# Altium schematic sheet System_CLK.SchDoc: Dystrybutory zegarów
size A3; Organization: Altium Limited; Address1: L3, 12a Rodborough Rd; Address2: Frenchs Forest; Address3: NSW; Address4: Australia 2086
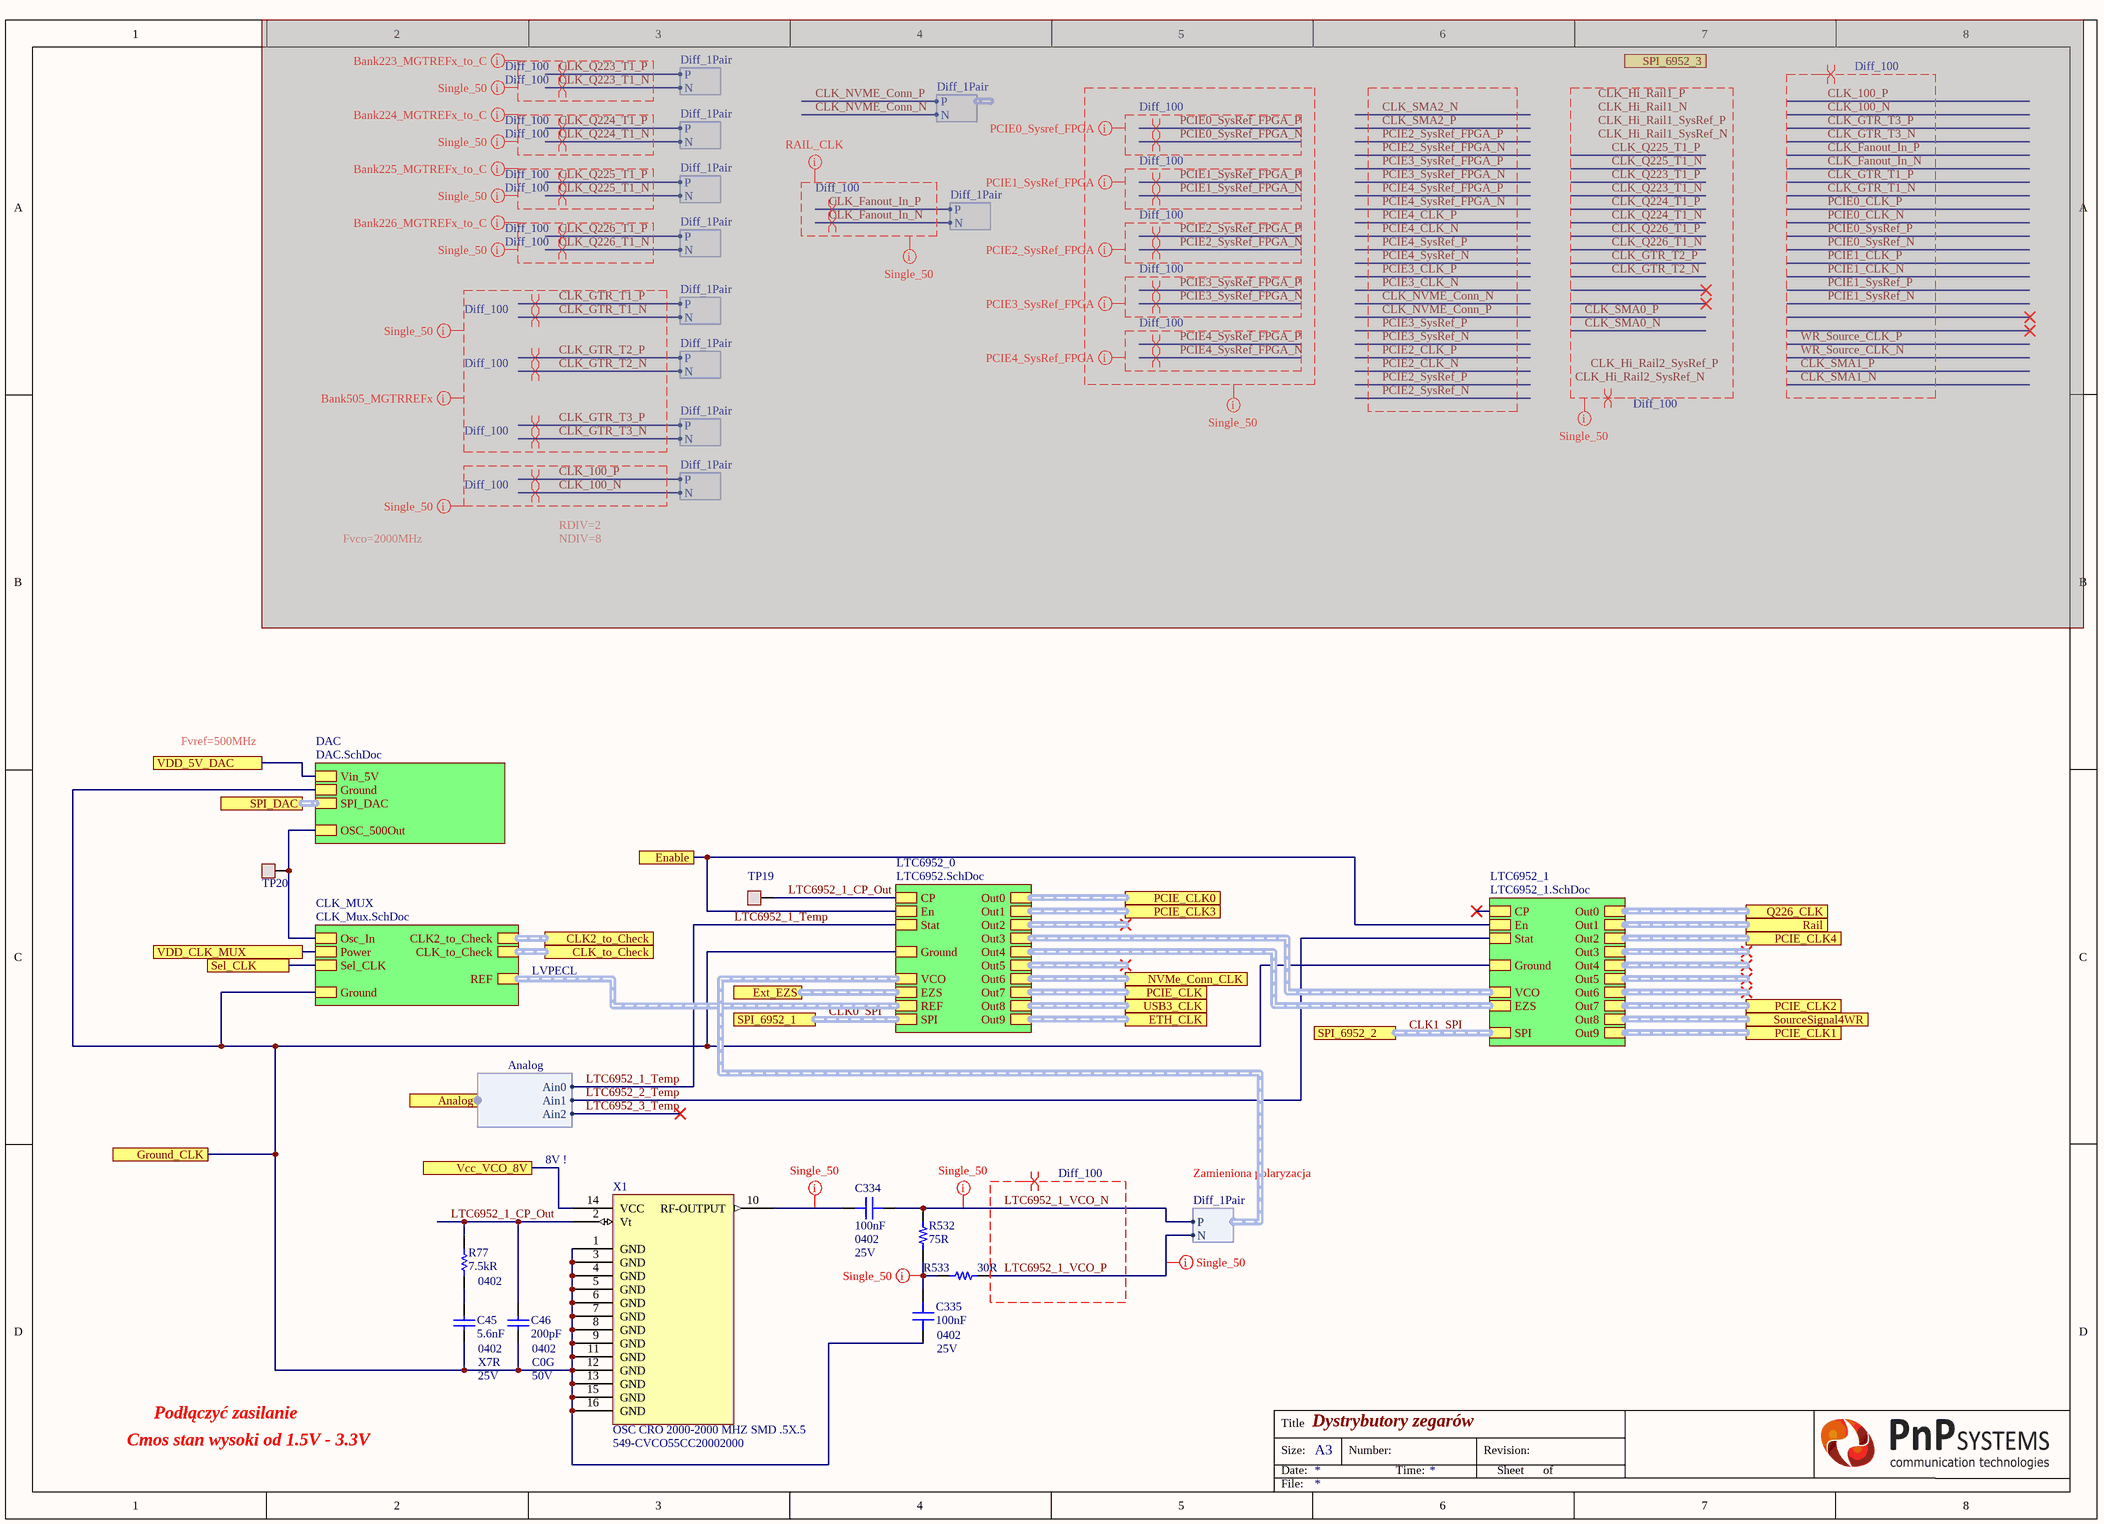
[diagram p0: System_CLK.SchDoc]

## Parts
C45  5.6nF  Case Code (Imperial): 0402  Voltage Rating: 25V  Dielectric: X7R  [CAP 0402/1005 KK]
C46  200pF  Case/Package: 0402  Voltage Rating: 50V  Dielectric: C0G  [CAP 0402/1005 KK]
C334  100nF  Case/Package: 0402  Voltage Rating: 25V  [CAP 0402/1005 KK]
C335  100nF  Case/Package: 0402  Voltage Rating: 25V  [CAP 0402/1005 KK]
R77  7.5kR  Case Code (Imperial): 0402  [RES 0402/1005 RF KK]
R532  75R  [RES 0402/1005 RF KK]
R533  30R  [RES 0402/1005 RF KK]
TP19  TestPoint  [TestPoint]  (value not drawn)
TP20  TestPoint  [TestPoint]  (value not drawn)
X1  OSC CRO 2000-2000 MHZ SMD .5X.5  Supplier Part Number 1: 549-CVCO55CC20002000  [CVCO55CW]

## Sub-sheets
CLK_MUX = CLK_Mux.SchDoc: Sel_CLK, REF (harness Diff_1Pair), Osc_In, Ground, Power, CLK_to_Check (harness Diff_1Pair), CLK2_to_Check (harness Diff_1Pair)
DAC = DAC.SchDoc: Vin_5V, SPI_DAC (harness SPI_H), Ground, OSC_500Out
LTC6952_0 = LTC6952.SchDoc: CP, Ground, Out6 (harness Diff_1Pair), VCO (harness Diff_1Pair), SPI (harness SPI_H), Stat, Out1 (harness Diff_1Pair), En, Out5 (harness Diff_1Pair), Out0 (harness Diff_1Pair), EZS (harness Diff_1Pair), Out2 (harness Diff_1Pair), Out7 (harness Diff_1Pair), REF (harness Diff_1Pair), Out8 (harness Diff_1Pair), Out3 (harness Diff_1Pair), Out4 (harness Diff_1Pair), Out9 (harness Diff_1Pair)
LTC6952_1 = LTC6952_1.SchDoc: EZS (harness Diff_1Pair), SPI (harness SPI_H), En, Out5 (harness Diff_1Pair), Ground, CP, Out4 (harness Diff_1Pair), Out6 (harness Diff_1Pair), VCO (harness Diff_1Pair), Out9 (harness Diff_1Pair), Stat, Out7 (harness Diff_1Pair), Out3 (harness Diff_1Pair), Out0 (harness Diff_1Pair), Out8 (harness Diff_1Pair), Out2 (harness Diff_1Pair), Out1 (harness Diff_1Pair)

## Ports
Analog (harness Analog), CLK2_to_Check (harness Diff_1Pair), CLK_to_Check (harness Diff_1Pair), Enable, ETH_CLK (harness Diff_1Pair), Ext_EZS (harness Diff_1Pair), Ground_CLK, NVMe_Conn_CLK (harness Diff_1Pair), PCIE_CLK0 (harness Diff_1Pair), PCIE_CLK1 (harness Diff_1Pair), PCIE_CLK2 (harness Diff_1Pair), PCIE_CLK3 (harness Diff_1Pair), PCIE_CLK4 (harness Diff_1Pair), PCIE_CLK (harness Diff_1Pair), Q226_CLK (harness Diff_1Pair), Rail (harness Diff_1Pair), Sel_CLK, SourceSignal4WR (harness Diff_1Pair), SPI_6952_1 (harness SPI_H), SPI_6952_2 (harness SPI_H), SPI_6952_3 (harness SPI_H), SPI_DAC (harness SPI_H), USB3_CLK (harness Diff_1Pair), Vcc_VCO_8V, VDD_5V_DAC, VDD_CLK_MUX

## Harnesses
Diff_1Pair: P, N
Analog: Ain0, Ain1, Ain2

## Nets
Enable: port Enable, sheet LTC6952_1/En, sheet LTC6952_0/En
Ground_CLK: C45.1 C46.1 C335.1 X1.1(GND) X1.3(GND) X1.4(GND) X1.5(GND) X1.6(GND) X1.7(GND) X1.8(GND) X1.9(GND) X1.11(GND) X1.12(GND) X1.13(GND) X1.15(GND) X1.16(GND) ; port Ground_CLK, sheet DAC/Ground, sheet CLK_MUX/Ground, sheet LTC6952_1/Ground, sheet LTC6952_0/Ground
LTC6952_1_CP_Out: C46.2 R77.2 TP19.1 X1.2(Vt) ; sheet LTC6952_0/CP
LTC6952_1_Temp: sheet LTC6952_0/Stat, port Analog.Ain0
LTC6952_1_VCO_N: C334.1 R532.2 ; sheet LTC6952_0/VCO.P
LTC6952_1_VCO_P: R533.2 ; sheet LTC6952_0/VCO.N
LTC6952_2_Temp: sheet LTC6952_1/Stat, port Analog.Ain1
LTC6952_3_Temp: port Analog.Ain2
Sel_CLK: port Sel_CLK, sheet CLK_MUX/Sel_CLK
Vcc_VCO_8V: X1.14(VCC) ; port Vcc_VCO_8V
VDD_5V_DAC: port VDD_5V_DAC, sheet DAC/Vin_5V
VDD_CLK_MUX: port VDD_CLK_MUX, sheet CLK_MUX/Power
NetC45_2: C45.2 R77.1
NetC334_2: C334.2 X1.10(RF-OUTPUT)
NetC335_2: C335.2 R532.1 R533.1
NetTP20_1: TP20.1 ; sheet DAC/OSC_500Out, sheet CLK_MUX/Osc_In

## Buses and harness runs
harness CLK0_SPI = port SPI_6952_1 = sheet LTC6952_0/SPI
harness CLK1_SPI = port SPI_6952_2 = sheet LTC6952_1/SPI
harness port CLK2_to_Check = sheet CLK_MUX/CLK2_to_Check
harness port CLK_to_Check = sheet CLK_MUX/CLK_to_Check
harness port ETH_CLK = sheet LTC6952_0/Out9
harness port Ext_EZS = sheet LTC6952_0/EZS
harness port NVMe_Conn_CLK = sheet LTC6952_0/Out6
harness port PCIE_CLK0 = sheet LTC6952_0/Out0
harness port PCIE_CLK1 = sheet LTC6952_1/Out9
harness port PCIE_CLK2 = sheet LTC6952_1/Out7
harness port PCIE_CLK3 = sheet LTC6952_0/Out1
harness port PCIE_CLK4 = sheet LTC6952_1/Out2
harness port PCIE_CLK = sheet LTC6952_0/Out7
harness port Q226_CLK = sheet LTC6952_1/Out0
harness port Rail = sheet LTC6952_1/Out1
harness port SourceSignal4WR = sheet LTC6952_1/Out8
harness port SPI_DAC = sheet DAC/SPI_DAC
harness port USB3_CLK = sheet LTC6952_0/Out8
harness sheet CLK_MUX/REF = sheet LTC6952_0/REF
harness sheet LTC6952_0/Out3 = sheet LTC6952_1/VCO
harness sheet LTC6952_0/Out4 = sheet LTC6952_1/EZS

## Layout directives
net class Bank223_MGTREFx_to_C: CLK_Q223_T1_N, CLK_Q223_T1_P
net class Bank224_MGTREFx_to_C: CLK_Q224_T1_N, CLK_Q224_T1_P
net class Bank225_MGTREFx_to_C: CLK_Q225_T1_N, CLK_Q225_T1_P
net class Bank226_MGTREFx_to_C: CLK_Q226_T1_N, CLK_Q226_T1_P
differential pair; differential pair class Diff_100: CLK_100_N, CLK_100_P, CLK_Fanout_In_N, CLK_Fanout_In_P, CLK_GTR_T1_N, CLK_GTR_T1_P, CLK_GTR_T2_N, CLK_GTR_T2_P, CLK_GTR_T3_N, CLK_GTR_T3_P, CLK_Hi_Rail1_N, CLK_Hi_Rail1_P, CLK_Hi_Rail1_SysRef_N, CLK_Hi_Rail1_SysRef_P, CLK_Hi_Rail2_SysRef_N, CLK_Hi_Rail2_SysRef_P, CLK_Q223_T1_N, CLK_Q223_T1_P, CLK_Q224_T1_N, CLK_Q224_T1_P, CLK_Q225_T1_N, CLK_Q225_T1_P, CLK_Q226_T1_N, CLK_Q226_T1_P, CLK_SMA0_N, CLK_SMA0_P, CLK_SMA1_N, CLK_SMA1_P, LTC6952_1_VCO_N, LTC6952_1_VCO_P, PCIE0_CLK_N, PCIE0_CLK_P, PCIE0_SysRef_FPGA_N, PCIE0_SysRef_FPGA_P, PCIE0_SysRef_N, PCIE0_SysRef_P, PCIE1_CLK_N, PCIE1_CLK_P, PCIE1_SysRef_FPGA_N, PCIE1_SysRef_FPGA_P, PCIE1_SysRef_N, PCIE1_SysRef_P, PCIE2_SysRef_FPGA_N, PCIE2_SysRef_FPGA_P, PCIE3_SysRef_FPGA_N, PCIE3_SysRef_FPGA_P, PCIE4_SysRef_FPGA_N, PCIE4_SysRef_FPGA_P, WR_Source_CLK_N, WR_Source_CLK_P
net class Single_50: CLK_100_N, CLK_100_P, CLK_Fanout_In_N, CLK_Fanout_In_P, CLK_GTR_T1_N, CLK_GTR_T1_P, CLK_GTR_T2_N, CLK_GTR_T2_P, CLK_GTR_T3_N, CLK_GTR_T3_P, CLK_Hi_Rail1_N, CLK_Hi_Rail1_P, CLK_Hi_Rail1_SysRef_N, CLK_Hi_Rail1_SysRef_P, CLK_Hi_Rail2_SysRef_N, CLK_Hi_Rail2_SysRef_P, CLK_Q223_T1_N, CLK_Q223_T1_P, CLK_Q224_T1_N, CLK_Q224_T1_P, CLK_Q225_T1_N, CLK_Q225_T1_P, CLK_Q226_T1_N, CLK_Q226_T1_P, CLK_SMA0_N, CLK_SMA0_P, LTC6952_1_VCO_N, LTC6952_1_VCO_P, NetC334_2, NetC335_2, PCIE0_SysRef_FPGA_N, PCIE0_SysRef_FPGA_P, PCIE1_SysRef_FPGA_N, PCIE1_SysRef_FPGA_P, PCIE2_SysRef_FPGA_N, PCIE2_SysRef_FPGA_P, PCIE3_SysRef_FPGA_N, PCIE3_SysRef_FPGA_P, PCIE4_SysRef_FPGA_N, PCIE4_SysRef_FPGA_P
net class Bank505_MGTRREFx_: CLK_GTR_T1_N, CLK_GTR_T1_P, CLK_GTR_T2_N, CLK_GTR_T2_P, CLK_GTR_T3_N, CLK_GTR_T3_P
net class RAIL_CLK: CLK_Fanout_In_N, CLK_Fanout_In_P
net class PCIE0_Sysref_FPGA: PCIE0_SysRef_FPGA_N, PCIE0_SysRef_FPGA_P
net class PCIE1_SysRef_FPGA: PCIE1_SysRef_FPGA_N, PCIE1_SysRef_FPGA_P
net class PCIE2_SysRef_FPGA: PCIE2_SysRef_FPGA_N, PCIE2_SysRef_FPGA_P
net class PCIE3_SysRef_FPGA: PCIE3_SysRef_FPGA_N, PCIE3_SysRef_FPGA_P
net class PCIE4_SysRef_FPGA: PCIE4_SysRef_FPGA_N, PCIE4_SysRef_FPGA_P

## Notes on the sheet
- RDIV=2
- Fvco=2000MHz
- NDIV=8
- Fvref=500MHz
- LVPECL
- 8V !
- Zamieniona polaryzacja
- Cmos stan wysoki od 1.5V - 3.3V
- Podłączyć zasilanie
- Title
- Size:
- Date:
- A3
- Number:
- Time:
- Revision:
- Sheet
- of
- File:

## Library data of the parts
C45 = Capacitor: Cap Ceramic 0.0056uF 25V X7R 10% SMD 0402 125C Paper T/R; Manufacturer: Yageo; Manufacturer Part Number: CC0402KRX7R8BB562; Supplier 1: Digi-Key; Supplier Part Number 1: 311-1718-1-ND; RoHS: Yes; Category: Ceramic Capacitors; Stock 1: 38070; Pricing 1: 1=0,10000, 10=0,03300, 100=0,01470, 500=0,01050, 1000=0,00825, 2500=0,00750, 5000=0,00690 (USD); Mount: Surface Mount; Case/Package: 0402; Number of Pins: 2; Weight: 2.3E-05oz; Case Code (Metric): 1005; Min Operating Temperature: -55°C; Max Operating Temperature: 125°C; Capacitance: 5.6nF; Tolerance: 10%; Packaging: Tape and Reel; Voltage Rating (DC): 25V; Termination: SMD/SMT; Composition: Ceramic; Length: 0.039inch; Width: 0.02inch; Thickness: 0.022inch; Depth: 0.5mm; Lead Free: Lead Free; Halogen Free: Halogen Free; ComponentLink1URL: https://datasheet.ciiva.com/13264/upy-gphc-x7r-6-3v-to-50v-8-12304-13264955.pdf?src-supplier=Mouser; ComponentLink1Description: https://datasheet.ciiva.com/13264/upy-gphc-x7r-6-3v-to-50v-8-12304-13264955.pdf?src-supplier=Mouser
C46 = Capacitor: Multilayer Ceramic Capacitors MLCC - SMD/SMT 200pF 50V NPO 5%; Manufacturer: Yageo; Manufacturer Part Number: CC0402JRNPO9BN201; Supplier 1: Digi-Key; Supplier Part Number 1: 311-1664-1-ND; RoHS: Yes; Category: Ceramic Capacitors; Stock 1: 33907; Pricing 1: 1=0,12000, 10=0,08900, 100=0,04160, 500=0,02918, 1000=0,02416, 2500=0,02249, 5000=0,02058 (USD); Mount: Surface Mount; Case Code (Imperial): 0402; Case Code (Metric): 1005; Min Operating Temperature: -55°C; Max Operating Temperature: 125°C; Tolerance: 5%; Capacitance: 200pF; Packaging: Tape and Reel; Termination: SMD/SMT; Length: 0.039inch; Width: 0.02inch; Thickness: 0.022inch; Depth: 0.5mm; Lead Free: Lead Free; ComponentLink1URL: http://www.mouser.com/ds/2/447/Yageo_UPY-GP_NP0_16V-to-50V_9-358835.pdf?src-supplier=Mouser; ComponentLink1Description: http://www.mouser.com/ds/2/447/Yageo_UPY-GP_NP0_16V-to-50V_9-358835.pdf?src-supplier=Mouser; ComponentLink2URL: http://components.arrow.com/part/dataview/0323_00775856?src-supplier=Arrow+Europe; ComponentLink2Description: http://components.arrow.com/part/dataview/0323_00775856?src-supplier=Arrow+Europe; ComponentLink3URL: http://www.yageo.com/documents/recent/UPY-GP_NP0_16V-to-50V_9.pdf?src-supplier=Future+Electronics; ComponentLink3Description: http://www.yageo.com/documents/recent/UPY-GP_NP0_16V-to-50V_9.pdf?src-supplier=Future+Electronics; ComponentLink4URL: http://www.yageo.com/documents/recent/UPY-GP_NP0_16V-to-50V_16.pdf?src-supplier=Digi-Key; ComponentLink4Description: http://www.yageo.com/documents/recent/UPY-GP_NP0_16V-to-50V_16.pdf?src-supplier=Digi-Key; ComponentLink5URL: http://www.yageo.com/exep/pages/download/literatures/ProductSelectionGuide%202014_Final_2.pdf?src-supplier=Digi-Key; ComponentLink5Description: http://www.yageo.com/exep/pages/download/literatures/ProductSelectionGuide%202014_Final_2.pdf?src-supplier=Digi-Key
C334 C335 = Capacitor: Manufacturer: Murata; Manufacturer Part Number: GRM155R71E104KE14J; Tolerance: 10%; Dielectric: X7R; Supplier 1: Digi-Key; Supplier Part Number 1: 490-14603-1-ND; Stock 1: 89275; Pricing 1: 1 = 0,10000, 10 = 0,03400, 100 = 0,01520, 500 = 0,01088, 1000 = 0,00855, 2500 = 0,00778, 5000 = 0,00715 (USD); RoHS: Yes; Mount: Surface Mount; Weight: 0.000212oz; Case Code (Imperial): 0402; Case Code (Metric): 1005; Min Operating Temperature: -55°C; Max Operating Temperature: 125°C; Packaging: Tape and Reel; Capacitance: 100nF; Termination: SMD/SMT; Composition: Ceramic; Voltage Rating (DC): 25V; Package Quantity: 50000; Length: 0.039inch; Height: 0.5mm; Width: 0.5mm; Thickness: 0.022inch; ComponentLink1URL: http://www.mouser.com/ds/2/281/c02e-2905.pdf?src-supplier=Mouser; ComponentLink1Description: http://www.mouser.com/ds/2/281/c02e-2905.pdf?src-supplier=Mouser; ComponentLink2URL: http://search.murata.co.jp/Ceramy/image/img/A01X/G101/ENG/GRM155R71E104KE14-01.pdf?src-supplier=Digi-Key; ComponentLink2Description: http://search.murata.co.jp/Ceramy/image/img/A01X/G101/ENG/GRM155R71E104KE14-01.pdf?src-supplier=Digi-Key
R77 = Resistor: RES SMD 7.5K OHM 0.5% 1/16W 0402; Manufacturer: Susumu; Manufacturer Part Number: RR0510P-752-D; Power Rating: 62.5mW; Voltage Rating: 25V; Max Power Dissipation: 63mW; Temperature Coefficient: 25ppm/°C; Voltage Rating (DC): 50V; Supplier 1: Digi-Key; Supplier Part Number 1: RR05P7.5KDCT-ND; RoHS: Yes; Category: Chip SMD Resistors; Stock 1: 33319; Pricing 1: 1=0,10000, 10=0,07400, 100=0,02850, 1000=0,01254, 2500=0,01083, 5000=0,00969 (USD); Case/Package: 0402; Case Code (Metric): 1005; Min Operating Temperature: -55°C; Max Operating Temperature: 125°C; Package Quantity: 1; Resistance: 7.5kR; Tolerance: 0.5%; Packaging: Tape and Reel; Composition: Thin Film; Number of Terminations: 2; Termination: SMD/SMT; Length: 0.039inch; Height: 0.016inch; Width: 0.02inch; Lead Free: Lead Free; ComponentLink1URL: https://datasheet.ciiva.com/2525/rr-data-sheet-2525152.pdf?src-supplier=Digi-Key; ComponentLink1Description: https://datasheet.ciiva.com/2525/rr-data-sheet-2525152.pdf?src-supplier=Digi-Key; ComponentLink2URL: https://datasheet.ciiva.com/2525/rr-data-sheet-2525153.pdf?src-supplier=Digi-Key; ComponentLink2Description: https://datasheet.ciiva.com/2525/rr-data-sheet-2525153.pdf?src-supplier=Digi-Key; ComponentLink3URL: https://datasheet.ciiva.com/2525/rr-data-sheet-2525154.pdf?src-supplier=Digi-Key; ComponentLink3Description: https://datasheet.ciiva.com/2525/rr-data-sheet-2525154.pdf?src-supplier=Digi-Key
R532 = Resistor: Res Thick Film 0402 75 Ohm 1% 1/10W 100ppm/C Molded SMD SMD Punched Carrier T/R; Manufacturer: Panasonic; Manufacturer Part Number: ERJ-2RKF75R0X; Voltage Rating: 50V; Power Rating: 100mW; Temperature Coefficient: 100ppm/°C; Supplier 1: Digi-Key; Supplier Part Number 1: P75.0LDKR-ND; RoHS: Yes; Category: Chip SMD Resistors; Stock 1: 1175660; Pricing 1: 1=0,10000, 10=0,04000, 100=0,01620, 1000=0,00729, 2500=0,00632, 5000=0,00523 (USD); Mount: Surface Mount; Case/Package: 0402; Case Code (Metric): 1005; Case Code (Imperial): 0402; Contact Plating: Tin; Min Operating Temperature: -55°C; Max Operating Temperature: 155°C; Tolerance: 1%; Packaging: Tape and Reel; Resistance: 75R; Package Quantity: 1; Composition: Thick Film; Number of Terminations: 2; Termination: SMD/SMT; Military Standard: Not; Max Power Dissipation: 100mW; Voltage Rating (DC): 50V; Features: Automotive AEC-Q200; Length: 1mm; Height: 0.35mm; Width: 0.02inch; Depth: 0.5mm; Radiation Hardening: No; REACH SVHC: No SVHC; Lead Free: Lead Free; ComponentLink1URL: https://datasheet.ciiva.com/11821/0900766b80f80784-11821360.pdf?src-supplier=RSComponents; ComponentLink1Description: https://datasheet.ciiva.com/11821/0900766b80f80784-11821360.pdf?src-supplier=RSComponents; ComponentLink2URL: https://datasheet.ciiva.com/30254/aoa0000ce2-30254694.pdf?src-supplier=Onlinecomponents.com; ComponentLink2Description: https://datasheet.ciiva.com/30254/aoa0000ce2-30254694.pdf?src-supplier=Onlinecomponents.com; ComponentLink3URL: https://datasheet.ciiva.com/43460/426256-43460278.pdf?src-supplier=Farnell; ComponentLink3Description: https://datasheet.ciiva.com/43460/426256-43460278.pdf?src-supplier=Farnell; ComponentLink4URL: https://datasheet.ciiva.com/16777/70260748-16777802.pdf?src-supplier=Allied+Electronics; ComponentLink4Description: https://datasheet.ciiva.com/16777/70260748-16777802.pdf?src-supplier=Allied+Electronics; ComponentLink5URL: https://datasheet.ciiva.com/24071/aoa0000ce2-24071598.pdf?src-supplier=Mouser; ComponentLink5Description: https://datasheet.ciiva.com/24071/aoa0000ce2-24071598.pdf?src-supplier=Mouser; ComponentLink6URL: https://datasheet.ciiva.com/16772/70260748-16772175.pdf?src-supplier=Allied+Electronics; ComponentLink6Description: https://datasheet.ciiva.com/16772/70260748-16772175.pdf?src-supplier=Allied+Electronics; ComponentLink7URL: https://datasheet.ciiva.com/46377/426256-46377007.pdf?src-supplier=Element14; ComponentLink7Description: https://datasheet.ciiva.com/46377/426256-46377007.pdf?src-supplier=Element14; ComponentLink8URL: https://datasheet.ciiva.com/48531/aoa0000ce2-48531055.pdf?src-supplier=Avnet; ComponentLink8Description: https://datasheet.ciiva.com/48531/aoa0000ce2-48531055.pdf?src-supplier=Avnet; ComponentLink9URL: https://datasheet.ciiva.com/5917/426256-5917818.pdf?src-supplier=Farnell; ComponentLink9Description: https://datasheet.ciiva.com/5917/426256-5917818.pdf?src-supplier=Farnell; ComponentLink10URL: https://datasheet.ciiva.com/46388/426256-46388476.pdf?src-supplier=Element14; ComponentLink10Description: https://datasheet.ciiva.com/46388/426256-46388476.pdf?src-supplier=Element14; ComponentLink11URL: https://datasheet.ciiva.com/9187/aoa0000ce2-9187662.pdf?src-supplier=Avnet; ComponentLink11Description: https://datasheet.ciiva.com/9187/aoa0000ce2-9187662.pdf?src-supplier=Avnet
R533 = Resistor: RES SMD 30 OHM 0.5% 1/16W 0402; Manufacturer: Panasonic; Manufacturer Part Number: ERA-2AKD300X; Power Rating: 62.5mW; Temperature Coefficient: 100ppm/°C; Max Power Dissipation: 63mW; Supplier 1: Digi-Key; Supplier Part Number 1: P30DDCT-ND; RoHS: Yes; Category: Chip SMD Resistors; Stock 1: 32301; Pricing 1: 1=0,10000, 10=0,07500, 100=0,03070, 1000=0,01377, 2500=0,01196, 5000=0,00988 (USD); Mount: Surface Mount; Case/Package: 0402; Case Code (Metric): 1005; Case Code (Imperial): 0402; Contact Plating: Tin; Min Operating Temperature: -55°C; Max Operating Temperature: 155°C; Resistance: 30R; Tolerance: 0.5%; Packaging: Tape and Reel; Package Quantity: 10000; Composition: Thin Film; Number of Terminations: 2; Length: 0.039inch; Height: 0.016inch; Width: 0.02inch; Lead Free: Lead Free; ComponentLink1URL: https://media.digikey.com/pdf/Data%20Sheets/Panasonic%20Resistors%20Thermistors%20PDFs/ERA_Series_LE.pdf?src-supplier=Digi-Key; ComponentLink1Description: https://media.digikey.com/pdf/Data%20Sheets/Panasonic%20Resistors%20Thermistors%20PDFs/ERA_Series_LE.pdf?src-supplier=Digi-Key; ComponentLink2URL: http://www.mouser.com/ds/2/315/AOA0000CE26-32660.pdf?src-supplier=Mouser; ComponentLink2Description: http://www.mouser.com/ds/2/315/AOA0000CE26-32660.pdf?src-supplier=Mouser; ComponentLink3URL: http://industrial.panasonic.com/www-data/pdf/AOA0000/AOA0000CE26.pdf?src-supplier=Avnet; ComponentLink3Description: http://industrial.panasonic.com/www-data/pdf/AOA0000/AOA0000CE26.pdf?src-supplier=Avnet; ComponentLink4URL: https://industrial.panasonic.com/cdbs/www-data/pdf/RDM0000/AOA0000C307.pdf?src-supplier=Digi-Key; ComponentLink4Description: https://industrial.panasonic.com/cdbs/www-data/pdf/RDM0000/AOA0000C307.pdf?src-supplier=Digi-Key
TP19 TP20 = TestPoint: Manufacturer: Keystone Electronics; Manufacturer Part Number: 5001; Plating: Silver; Body Material: PBT,Bronze; Number of Ports: 1; Insulation: Insulated; Inside Diameter: 1.27mm; Outside Diameter: 2.54mm; Hole Diameter: 1.6mm; Supplier 1: Digi-Key; Stock 1: 352180; Pricing 1: 1 = 0,35000, 10 = 0,33500, 25 = 0,30800, 100 = 0,30150, 250 = 0,28304, 500 = 0,25230, 1000 = 0,17140, 2500 = 0,15296, 5000 = 0,14340 (USD); RoHS: Yes; Mount: Through Hole,PCB; Color: Black; Contact Material: Bronze; Contact Plating: Silver,Tin; Material: Nylon,Bronze,Silver; Housing Color: Black; Packaging: Bulk; Package Quantity: 100; Termination: Through Hole; Number of Contacts: 1; Orientation: Straight; Diameter: 2.54mm; Length: 7.62mm; Height: 0.3inch; Lead Free: Lead Free; REACH SVHC: No SVHC; Flammability Rating: UL94 V-0; ComponentLink1URL: https://datasheet.ciiva.com/27052/1581986-27052611.pdf?src-supplier=Jameco; ComponentLink1Description: https://datasheet.ciiva.com/27052/1581986-27052611.pdf?src-supplier=Jameco; ComponentLink2URL: https://datasheet.ciiva.com/11836/0900766b8009b7c7-11836045.pdf?src-supplier=RSComponents; ComponentLink2Description: https://datasheet.ciiva.com/11836/0900766b8009b7c7-11836045.pdf?src-supplier=RSComponents; ComponentLink3URL: https://datasheet.ciiva.com/22631/1703983-22631100.pdf?src-supplier=Element14; ComponentLink3Description: https://datasheet.ciiva.com/22631/1703983-22631100.pdf?src-supplier=Element14; ComponentLink4URL: https://datasheet.ciiva.com/16318/m60-2p60-16318423.pdf?src-supplier=Future+Electronics; ComponentLink4Description: https://datasheet.ciiva.com/16318/m60-2p60-16318423.pdf?src-supplier=Future+Electronics; Supplier Part Number 1: 36-5001-ND
X1 = CVCO55CC-2000-2000: Manufacturer: Crystek; Frequency: 2GHz; Load Capacitance: 22pF; Operating Supply Voltage: 8V; Supplier 1: Mouser; Manufacturer Part Number: CVCO55CC-2000-2000; Stock 1: 18; Pricing 1: 1 = 32,65000, 5 = 31,16000, 10 = 28,20000, 25 = 26,71000, 50 = 25,23000, 100 = 22,26000 (USD); RoHS: Yes; Min Operating Temperature: -30°C; Max Operating Temperature: 85°C; Packaging: Cut Tape; Package Quantity: 1; Termination: SMD/SMT; Length: 0.5inch; Height: 0.22inch; Width: 0.5inch; ComponentLink1URL: https://datasheet.ciiva.com/12380/cvco55cc-2000-2000-218619-12380053.pdf?src-supplier=Mouser; ComponentLink1Description: https://datasheet.ciiva.com/12380/cvco55cc-2000-2000-218619-12380053.pdf?src-supplier=Mouser; ComponentLink2URL: https://datasheet.ciiva.com/6719/cvco55cc-2000-2000-6719815.pdf?src-supplier=Digi-Key; ComponentLink2Description: https://datasheet.ciiva.com/6719/cvco55cc-2000-2000-6719815.pdf?src-supplier=Digi-Key